# EAGLE design scd41 (EAGLE 9.5.1)
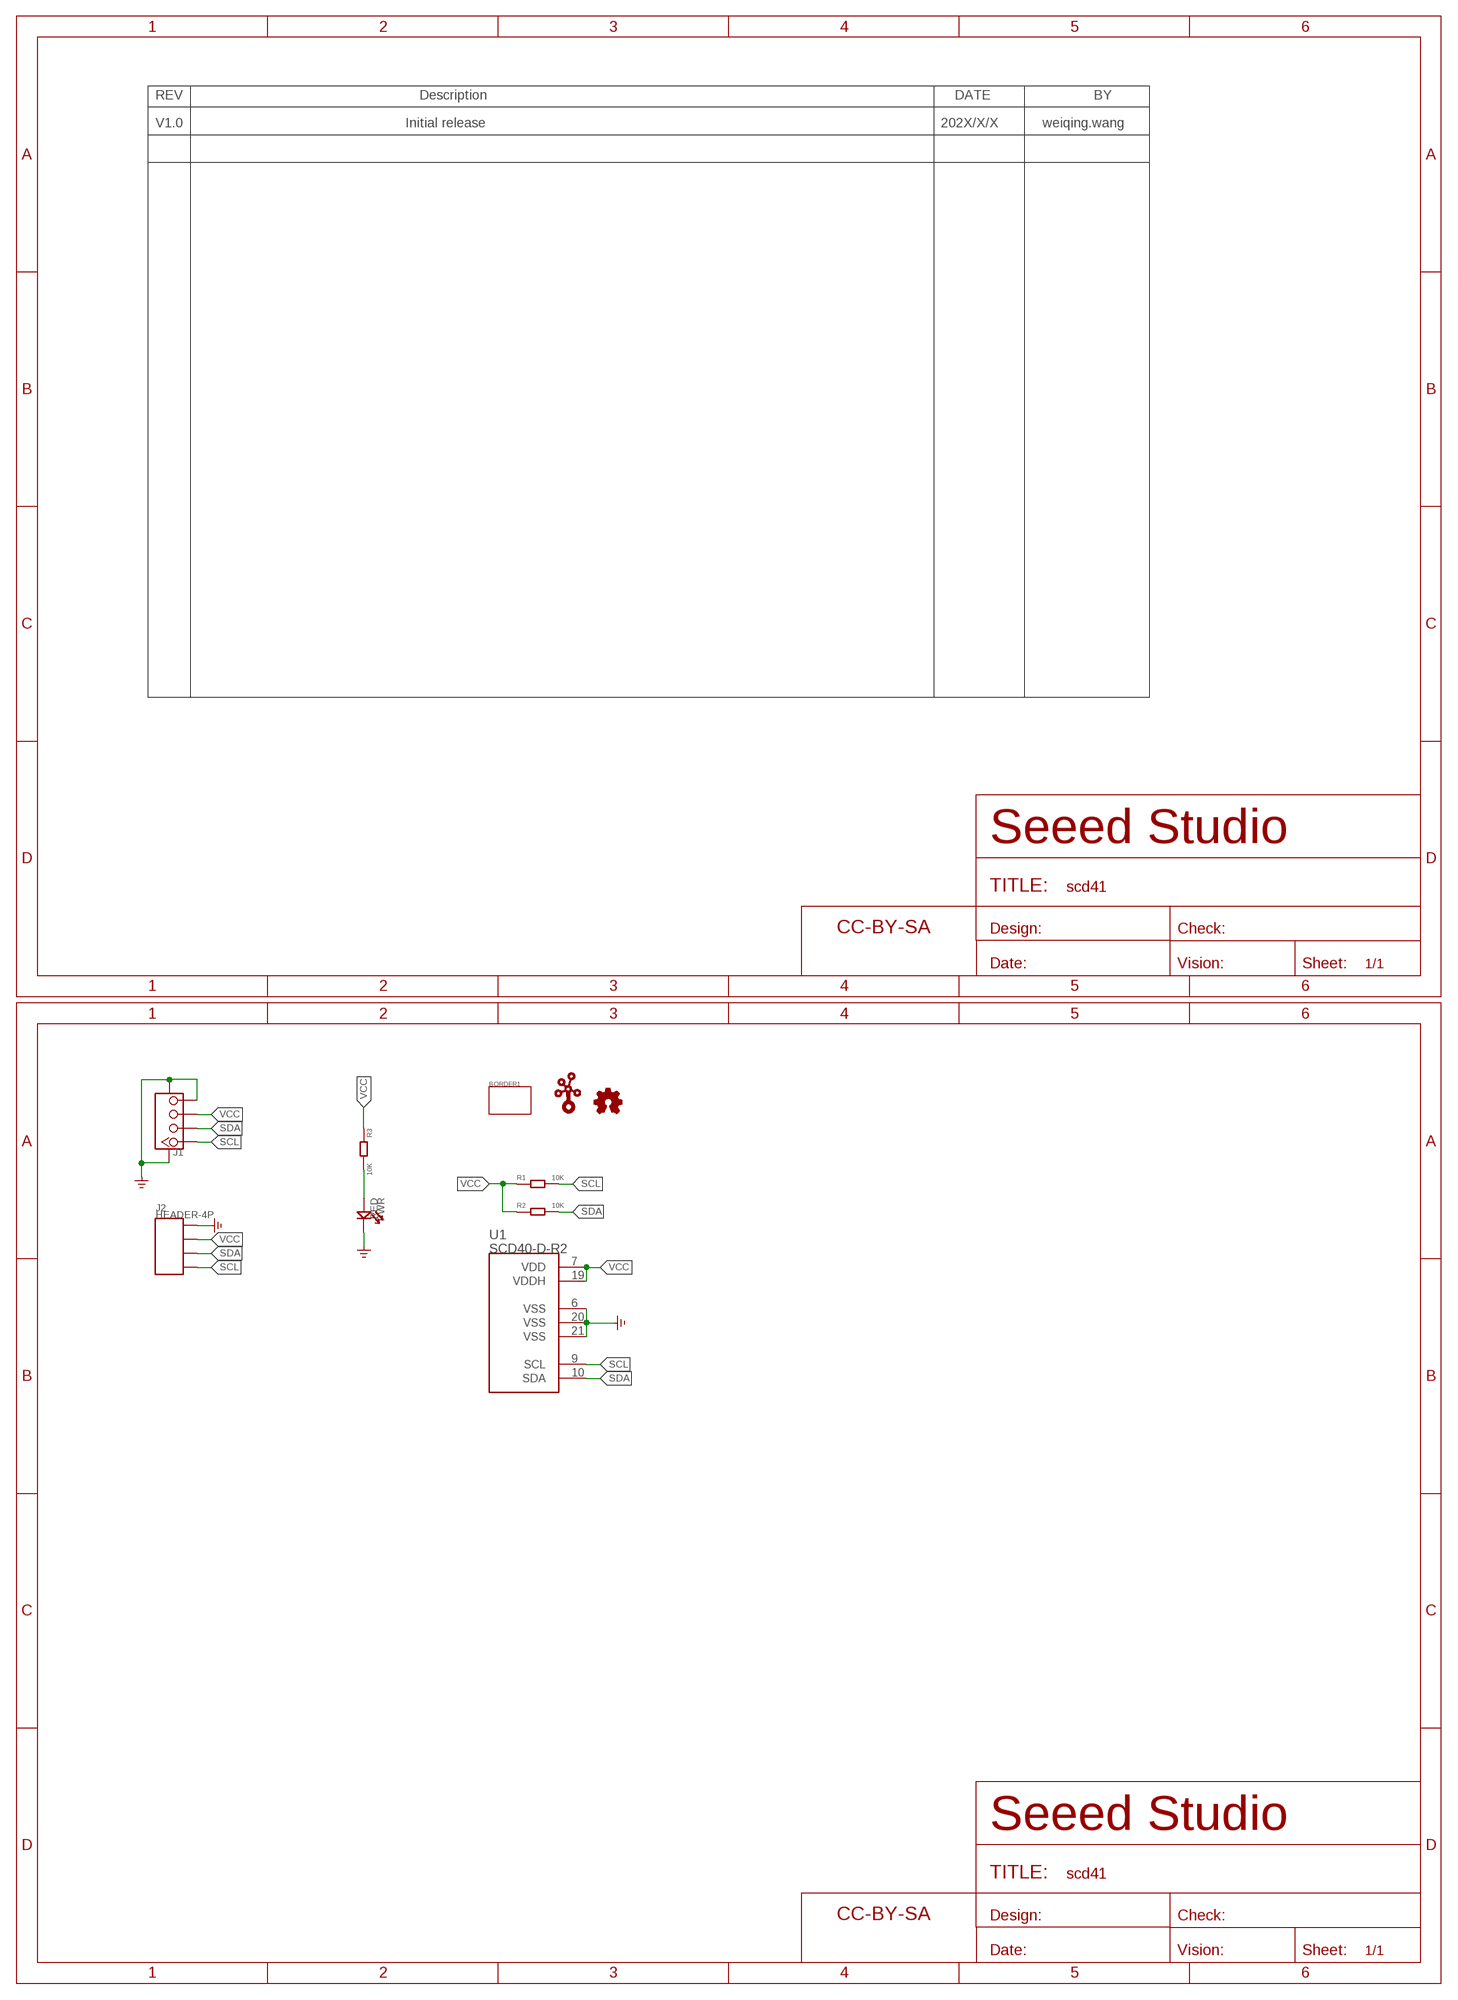
[diagram p0: schematic, sheet 1]

## Parts
BORDER1  BORDER_TWIG1U  [BORDER_1U-DIM-W/-DRILL]
FRAME1  FRAME  [CREATIVECOMMONS]
FRAME2  FRAME  [CREATIVECOMMONS]
J1  GROVE_4P-2.0\SMD\FEMALE-HORIZONTAL  [GROVE_4P-2.0\SMD\HOR]
J2  HEADER-4P  [HEADER-4P]
LOGO1  LOGO_GROVETWIGLOGO_SMALL  [LOGO_GROVE-SILK-SMALL]
LOGO2  LOGO_OSHWX0100-NT  [LOGO_OSHW_FILLX100_NOTEXT]
PWR  RED  LED0603  [LED-0603]
R1  10K  RES\0603N  [R0603_NORMAL]
R2  10K  RES\0603N  [R0603_NORMAL]
R3  10K  RES\0603N  [R0603_NORMAL]
U1  SCD40-D-R2  [SCD40-D-R2]

## Nets
GND: J1.4 J1.SS1 J1.SS2 J2.P$1 PWR.- U1.6(VSS) U1.20(VSS) U1.21(VSS) ; supply symbol labelled POWERSYMBOL-GND
N$5: PWR.+ R3.2
SCL: J1.1 J2.P$4 R1.2 U1.9(SCL)
SDA: J1.2 J2.P$3 R2.2 U1.10(SDA)
VCC: J1.3 J2.P$2 R1.1 R2.1 R3.1 U1.7(VDD) U1.19(VDDH)

## Notes on the sheet
- V1.0 | Initial release | 202X/X/X | weiqing.wang

## Library data of the parts
BORDER1 = Seeed-OTHER:BORDER_TWIG
FRAME1 FRAME2 = Seeed-OTHER:FRAME
J1 = Seeed-Con:GROVE_4P-2.0\SMD\FEMALE
J2 = Grove - CO2(SCD41) Sensor v1.0:HEADER-4P
LOGO1 = Seeed-OTHER:LOGO_GROVE; PARTNO: DNP
LOGO2 = Seeed-OTHER:LOGO_OSHW; PARTNO: DNP
PWR = Seeed-Discrete:LED
R1-R3 = Seeed-Discrete:RES
U1 = Grove - CO2(SCD41) Sensor v1.0:SCD40-D-R2

## Board
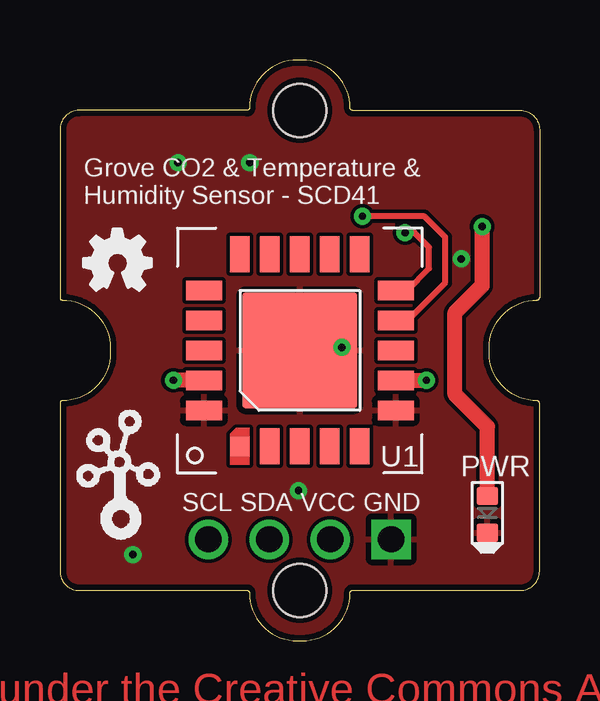
[diagram p1: board, top side]
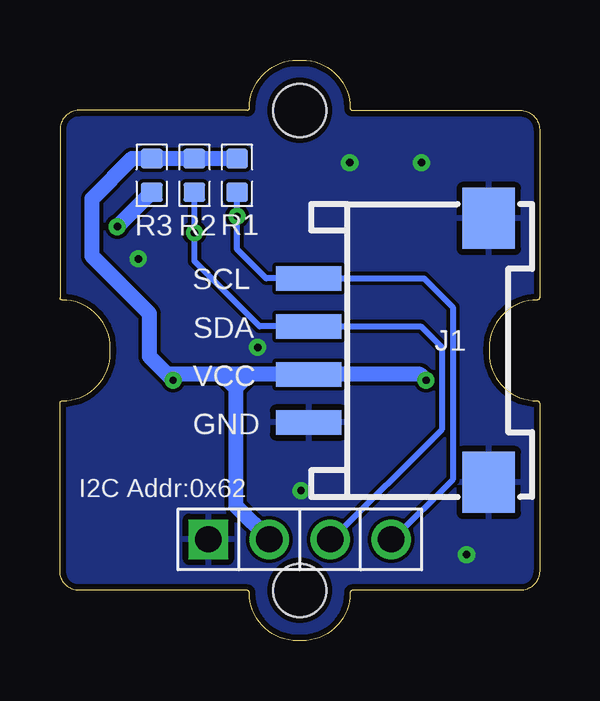
[diagram p2: board, bottom side, seen from below]

Size 20 x 24.2 mm. Coordinates in mm from the lower left corner, seen from the top.
Copper layers (1*16): Top 0.035mm / dielectric 1.5mm / Bottom 0.035mm
Design rules "default *": minimum track width 6mil, minimum drill 0.3mm, track to track 6mil, track to pad 6mil, pad to pad 6mil, via to via 6mil, smd to smd 6mil, copper to edge 10mil, drill to drill 6mil, minimum pad ring 10mil, minimum via ring 8mil, stop-mask expansion 4mil, vias tented up to drill 100mil, thermal gap 10mil

### Footprints (pad centres in the part's own frame; a part is rotated, then mirrored left to right if it is on the bottom)
BORDER_1U-DIM-W/-DRILL = hole 2.2: 0,-10; 0,10
GROVE_4P-2.0\SMD\HOR = smd 1.01 x 2.74: 1 -3,-0.1; 2 -1,-0.1; 3 1,-0.1; 4 3,-0.1 | smd 2.54 x 2.184: SS1 -5.5,7.4; SS2 5.5,7.4
HEADER-4P = drill 1.092 pad 1.6 square: P$1 -3.81,0 | drill 1.092 pad 1.6: P$2 -1.27,0; P$3 1.27,0; P$4 3.81,0
LED-0603 = smd 0.762 x 0.889: + 0.762,0; - -0.762,0
R0603_NORMAL = smd 0.8 x 0.902: 1 0.699,0; 2 -0.699,0
SCD40-D-R2 = smd 0.8 x 0.8: 1 -4,2.5 | smd 1.5 x 0.8: 2 -4,1.25; 3 -4,0; 4 -4,-1.25; 5 -4,-2.5; 11 4,-2.5; 12 4,-1.25; 13 4,0; 14 4,1.25; 15 4,2.5 | smd 0.8 x 1.5: 6 -2.5,-4; 7 -1.25,-4; 8 0,-4; 9 1.25,-4; 10 2.5,-4; 16 2.5,4; 17 1.25,4; 18 0,4; 19 -1.25,4; 20 -2.5,4 | smd 4.8 x 4.8: 21 0,0

### Placement (x,y rotation side)
BORDER1  10,12.1 0 top
FRAME1  -19.79,-6.44 0 top  (outside the outline)
FRAME2  -19.9,-13.53 0 top  (outside the outline)
J1  9.52,12.1 270 bottom
J2  10,4.23 180 top
LOGO1  0.3,4.1 0 top
LOGO2  0.98,14.61 0 top
PWR  17.82,5.27 90 top
R1  12.62,19.39 90 bottom
R2  14.39,19.39 90 bottom
R3  16.17,19.39 90 bottom
U1  10,12.1 90 top

### Tracks (layer width: path | path; a pad name or v marks a point on that pad's centre or on a via)
GND  (via drill 0.3 pad 0.61)
  other vias: 7.92,19.92 11.75,12.23 16.73,15.91 9.95,6.26 4.92,19.92 3.04,3.59
  pour Top: -0.79,24.16 -0.79,0.04 1.11,0.04 1.11,-0.6 2.38,-0.6 2.38,0.04 20.8,0.04 20.8,24.16
  pour Bottom: -0.79,24.16 -0.79,0.04 1.11,0.04 1.11,-1.24 2.38,-1.24 2.38,0.04 20.8,0.04 20.8,24.16
N$5  (via drill 0.3 pad 0.61)
  Top 0.635: PWR.+ 17.82,8.93 16.48,10.27 16.48,13.67 17.6,14.79 v17.6,17.25 v17.61,17.26
  Bottom 0.635: R3.2 v17.61,17.26
SCL  (via drill 0.3 pad 0.61)
  Top 0.254: v12.62,17.69 15.21,17.69 16.07,16.82 16.07,14.92 14.5,13.35 U1.9
  Bottom 0.254: R1.2 v12.62,17.69 12.62,16.32 11.4,15.1 J1.1 4.82,15.1 3.62,13.9 3.62,6.71 6.11,4.23 J2.P$4
SDA  (via drill 0.3 pad 0.61)
  Top 0.254: v14.39,17 14.79,17 15.4,16.39 15.4,15.51 14.48,14.6 U1.10
  Bottom 0.254: R2.2 v14.39,17 14.39,15.82 11.67,13.1 J1.2 4.96,13.1 4.08,12.23 4.08,8.8 8.65,4.23 J2.P$3
VCC  (via drill 0.3 pad 0.61)
  Top 0.635: v4.73,10.86 v4.74,10.85 U1.19 | U1.7 v15.28,10.86
  Bottom 0.635: v4.73,10.86 4.98,11.1 J1.3 12.11,11.1 | 12.11,11.1 12.67,11.1 | 12.67,11.1 13.23,11.1 | 12.67,10.54 12.67,11.1 | 12.11,11.1 12.67,10.54 | 12.67,10.54 13.23,11.1 | 15.53,11.1 16.27,11.84 16.27,13.63 18.67,16.03 18.67,18.43 17,20.09 R3.1 R2.1 R1.1 | 15.04,11.1 15.53,11.1 | 15.53,11.1 v15.28,10.86 15.04,11.1 | 13.23,11.1 15.04,11.1 | J2.P$2 12.67,5.62 12.67,10.54

### Text on the board
tPlace: Grove CO2 & Temperature & / Humidity Sensor - SCD41 | SCL | SDA | VCC | GND
bPlace: SCL | SDA | VCC | GND | I2C Addr:0x62